# Altium project LED_Strip_ASSI.PrjPcb
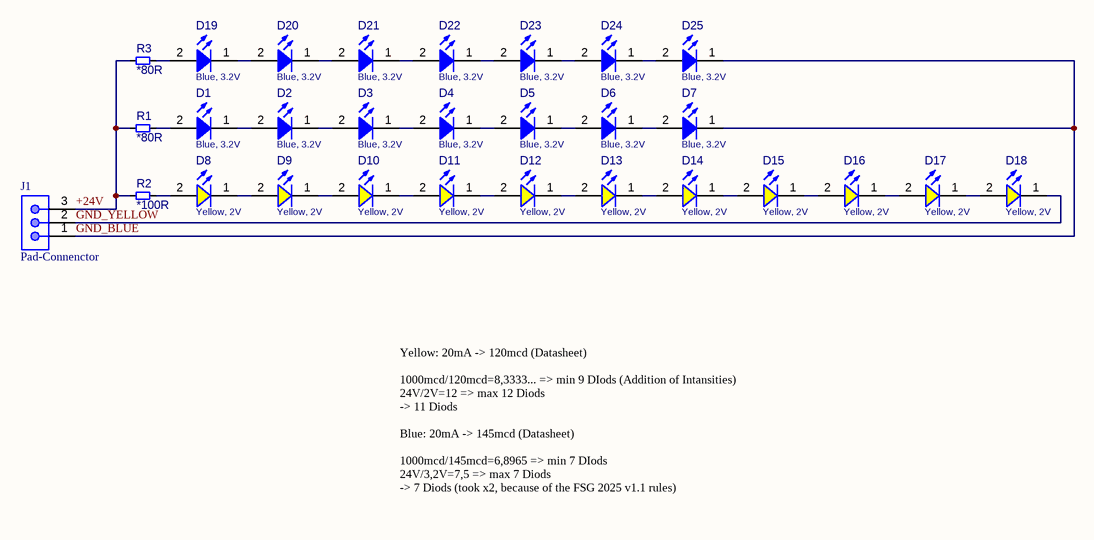
[diagram p0: Schmematics1.SchDoc]
1 sheet, 29 parts. Net scope: global (net labels, ports and power ports of the same name join across sheets).
Board file: PCB1.PcbDoc

## Sheet Schmematics1.SchDoc
size A4; SheetNumber: 1; SheetTotal: 1

### Parts
D1  Blue, 3.2V  [LED_WL-SMCW_0603_H=0.7mm]
D2  Blue, 3.2V  [LED_WL-SMCW_0603_H=0.7mm]
D3  Blue, 3.2V  [LED_WL-SMCW_0603_H=0.7mm]
D4  Blue, 3.2V  [LED_WL-SMCW_0603_H=0.7mm]
D5  Blue, 3.2V  [LED_WL-SMCW_0603_H=0.7mm]
D6  Blue, 3.2V  [LED_WL-SMCW_0603_H=0.7mm]
D7  Blue, 3.2V  [LED_WL-SMCW_0603_H=0.7mm]
D8  Yellow, 2V  [LED_WL-SMCW_0603_H=0.7mm]
D9  Yellow, 2V  [LED_WL-SMCW_0603_H=0.7mm]
D10  Yellow, 2V  [LED_WL-SMCW_0603_H=0.7mm]
D11  Yellow, 2V  [LED_WL-SMCW_0603_H=0.7mm]
D12  Yellow, 2V  [LED_WL-SMCW_0603_H=0.7mm]
D13  Yellow, 2V  [LED_WL-SMCW_0603_H=0.7mm]
D14  Yellow, 2V  [LED_WL-SMCW_0603_H=0.7mm]
D15  Yellow, 2V  [LED_WL-SMCW_0603_H=0.7mm]
D16  Yellow, 2V  [LED_WL-SMCW_0603_H=0.7mm]
D17  Yellow, 2V  [LED_WL-SMCW_0603_H=0.7mm]
D18  Yellow, 2V  [LED_WL-SMCW_0603_H=0.7mm]
D19  Blue, 3.2V  [LED_WL-SMCW_0603_H=0.7mm]
D20  Blue, 3.2V  [LED_WL-SMCW_0603_H=0.7mm]
D21  Blue, 3.2V  [LED_WL-SMCW_0603_H=0.7mm]
D22  Blue, 3.2V  [LED_WL-SMCW_0603_H=0.7mm]
D23  Blue, 3.2V  [LED_WL-SMCW_0603_H=0.7mm]
D24  Blue, 3.2V  [LED_WL-SMCW_0603_H=0.7mm]
D25  Blue, 3.2V  [LED_WL-SMCW_0603_H=0.7mm]
J1  Pad-Connenctor  [TSAL-L Connector]
R1  Resistance: *80R  [0603(1608)_L]  (hidden comment: Resistor)
R2  Resistance: *100R  [0603(1608)_L]  (hidden comment: Resistor)
R3  Resistance: *80R  [0603(1608)_L]  (hidden comment: Resistor)

### Nets
+24V: J1.3 R1.1 R2.1 R3.1
GND_BLUE: D7.1(K) D25.1(K) J1.1
GND_YELLOW: D18.1(K) J1.2
NetD1_1: D1.1(K) D2.2(A)
NetD1_2: D1.2(A) R1.2
NetD2_1: D2.1(K) D3.2(A)
NetD3_1: D3.1(K) D4.2(A)
NetD4_1: D4.1(K) D5.2(A)
NetD5_1: D5.1(K) D6.2(A)
NetD6_1: D6.1(K) D7.2(A)
NetD8_1: D8.1(K) D9.2(A)
NetD8_2: D8.2(A) R2.2
NetD9_1: D9.1(K) D10.2(A)
NetD10_1: D10.1(K) D11.2(A)
NetD11_1: D11.1(K) D12.2(A)
NetD12_1: D12.1(K) D13.2(A)
NetD13_1: D13.1(K) D14.2(A)
NetD14_1: D14.1(K) D15.2(A)
NetD15_1: D15.1(K) D16.2(A)
NetD16_1: D16.1(K) D17.2(A)
NetD17_1: D17.1(K) D18.2(A)
NetD19_1: D19.1(K) D20.2(A)
NetD19_2: D19.2(A) R3.2
NetD20_1: D20.1(K) D21.2(A)
NetD21_1: D21.1(K) D22.2(A)
NetD22_1: D22.1(K) D23.2(A)
NetD23_1: D23.1(K) D24.2(A)
NetD24_1: D24.1(K) D25.2(A)

### Notes on the sheet
- Yellow: 20mA -> 120mcd (Datasheet)
  1000mcd/120mcd=8,3333... => min 9 DIods (Addition of Intansities)
  24V/2V=12 => max 12 Diods
  -> 11 Diods
  Blue: 20mA -> 145mcd (Datasheet)
  1000mcd/145mcd=6,8965 => min 7 DIods
  24V/3,2V=7,5 => max 7 Diods
  -> 7 Diods (took x2, because of the FSG 2025 v1.1 rules)

### Library data of the parts
D1-D7 D19-D25 = LED-WL-SMCW-150060BS75000: WL-SMCW SMT Mono-color Chip LED Waterclear, size 0603, Blue, 3.2V, 140deg; Manufacturer: Wurth Elektronik; Chip Technology: InGaN; Dominant Wavelength typ.: 470nm; Luminous Intensity typ.: 145mcd; Peak Wavelength typ.: 465nm; Viewing Angle: 140deg; ComponentLink1Description: Manufacturer; ComponentLink1URL: http://www.we-online.de; ComponentLink2URL: https://www.we-online.com/catalog/datasheet/150060BS75000.pdf; ComponentLink2Description: Datasheet; Forward Voltage typ.: 3.2V; Emitting Color: Blue; Mounting Technology: SMT; Operating Temperature: -40 to +85degC; Published Date: December 2019; PartNumber: 150060BS75000; Packaging: Tape and Reel; Size: 0603
D8-D18 = LED-WL-SMCW-150060YS75000: WL-SMCW SMT Mono-color Chip LED Waterclear, size 0603, Yellow, 2V, 140deg; Manufacturer: Wurth Elektronik; Chip Technology: AlInGaP; Dominant Wavelength typ.: 590nm; Luminous Intensity typ.: 120mcd; Peak Wavelength typ.: 595nm; Viewing Angle: 140deg; ComponentLink1Description: Manufacturer; ComponentLink1URL: http://www.we-online.de; ComponentLink2URL: https://www.we-online.com/catalog/datasheet/150060YS75000.pdf; ComponentLink2Description: Datasheet; Forward Voltage typ.: 2V; Emitting Color: Yellow; Mounting Technology: SMT; Operating Temperature: -40 to +85degC; Published Date: December 2019; Part Number: 150060YS75000; Packaging: Tape and Reel; Size: 0603
J1 = Pad-Connector
R1 R3 = RES-Std: General resistor; Value: *80R; Tolerance: *%; Power (W): *; Manufacturer P/N: *; Current (A): *; Type: *; Voltage (V): *; Manufacturer: *; Capacitance: *
R2 = RES-Std: General resistor; Value: *100R; Tolerance: *%; Power (W): *; Manufacturer P/N: *; Current (A): *; Type: *; Voltage (V): *; Manufacturer: *; Capacitance: *